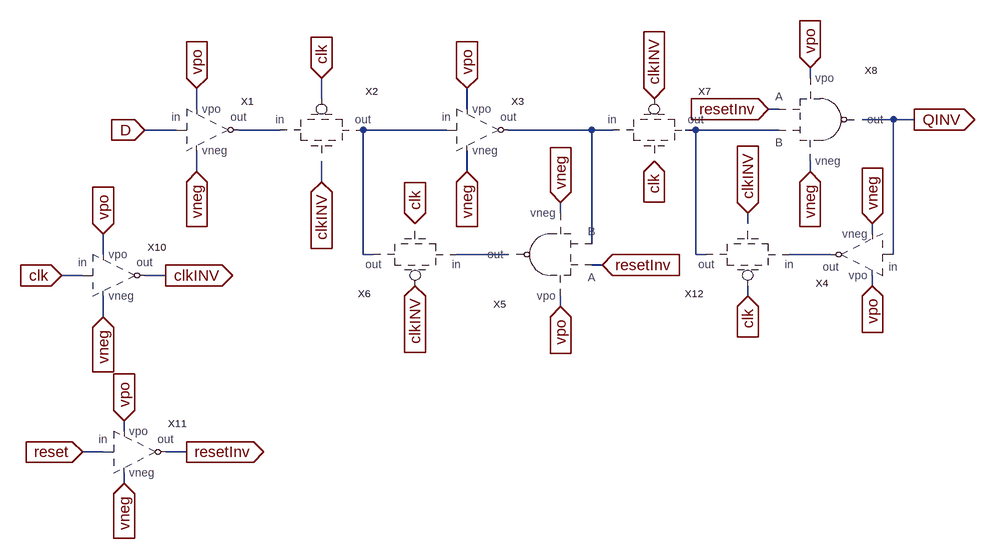
[diagram p0: schematic DFlipFlop.asc]
DFlipFlop.asc, the LTspice schematic file:
Version 4
SHEET 1 1584 1416
WIRE 1168 192 1168 176
WIRE 416 224 416 192
WIRE 224 240 224 208
WIRE 640 240 640 208
WIRE 1120 240 1104 240
WIRE 1296 256 1248 256
WIRE 1328 256 1296 256
WIRE 192 272 144 272
WIRE 352 272 288 272
WIRE 608 272 480 272
WIRE 832 272 704 272
WIRE 864 272 832 272
WIRE 992 272 976 272
WIRE 1120 272 992 272
WIRE 224 336 224 304
WIRE 640 336 640 304
WIRE 1168 336 1168 320
WIRE 416 352 416 320
WIRE 784 400 784 384
WIRE 1072 416 1072 400
WIRE 1264 432 1264 416
WIRE 832 448 832 272
WIRE 80 464 80 432
WIRE 480 464 480 272
WIRE 496 464 480 464
WIRE 704 464 624 464
WIRE 992 464 992 272
WIRE 1008 464 992 464
WIRE 1200 464 1136 464
WIRE 1296 464 1296 256
WIRE 848 480 832 480
WIRE 48 496 16 496
WIRE 176 496 144 496
WIRE 1264 512 1264 496
WIRE 1072 528 1072 512
WIRE 784 544 784 528
WIRE 80 560 80 528
WIRE 112 736 112 720
WIRE 80 768 48 768
WIRE 208 768 176 768
WIRE 112 816 112 800
FLAG 144 272 D
IOPIN 144 272 In
FLAG 16 496 clk
IOPIN 16 496 In
FLAG 176 496 clkINV
IOPIN 176 496 Out
FLAG 416 192 clk
IOPIN 416 192 In
FLAG 416 352 clkINV
IOPIN 416 352 In
FLAG 640 336 vneg
IOPIN 640 336 In
FLAG 640 208 vpo
IOPIN 640 208 In
FLAG 224 208 vpo
IOPIN 224 208 In
FLAG 928 320 clk
IOPIN 928 320 In
FLAG 928 224 clkINV
IOPIN 928 224 In
FLAG 560 512 clkINV
IOPIN 560 512 In
FLAG 560 416 clk
IOPIN 560 416 In
FLAG 224 336 vneg
IOPIN 224 336 In
FLAG 784 384 vneg
IOPIN 784 384 In
FLAG 1168 336 vneg
IOPIN 1168 336 In
FLAG 1264 416 vneg
IOPIN 1264 416 In
FLAG 784 544 vpo
IOPIN 784 544 In
FLAG 1168 176 vpo
IOPIN 1168 176 In
FLAG 1264 512 vpo
IOPIN 1264 512 In
FLAG 848 480 resetInv
IOPIN 848 480 In
FLAG 1104 240 resetInv
IOPIN 1104 240 In
FLAG 48 768 reset
IOPIN 48 768 In
FLAG 208 768 resetInv
IOPIN 208 768 Out
FLAG 80 432 vpo
IOPIN 80 432 In
FLAG 80 560 vneg
IOPIN 80 560 In
FLAG 112 816 vneg
IOPIN 112 816 In
FLAG 112 720 vpo
IOPIN 112 720 In
FLAG 1072 528 clk
IOPIN 1072 528 In
FLAG 1072 400 clkINV
IOPIN 1072 400 In
FLAG 1328 256 QINV
IOPIN 1328 256 Out
SYMBOL Inverter 224 272 R0
SYMATTR InstName X1
SYMBOL Transmissiongate 416 272 R0
SYMATTR InstName X2
SYMBOL Inverter 640 272 R0
SYMATTR InstName X3
SYMBOL Inverter 1264 464 R180
SYMATTR InstName X4
SYMBOL NAND 768 464 R180
SYMATTR InstName X5
SYMBOL Transmissiongate 560 464 R180
SYMATTR InstName X6
SYMBOL Transmissiongate 928 272 R0
SYMATTR InstName X7
SYMBOL NAND 1184 256 R0
SYMATTR InstName X8
SYMBOL Inverter 80 496 R0
SYMATTR InstName X10
SYMBOL Inverter 112 768 R0
SYMATTR InstName X11
SYMBOL Transmissiongate 1072 464 R180
SYMATTR InstName X12

The netlist it stands for:
* DFlipFlop.asc
XX1 D N001 vpo vneg Inverter  ; pins in out vpo vneg
XX2 N001 clk clkINV N002 Transmissiongate  ; pins in SigPmos SigNmos out
XX3 N002 N003 vpo vneg Inverter  ; pins in out vpo vneg
XX4 QINV N006 vpo vneg Inverter  ; pins in out vpo vneg
XX5 vpo vneg N005 resetInv N003 NAND  ; pins vpo vneg out A B
XX6 N005 clkINV clk N002 Transmissiongate  ; pins in SigPmos SigNmos out
XX7 N003 clkINV clk N004 Transmissiongate  ; pins in SigPmos SigNmos out
XX8 vpo vneg QINV resetInv N004 NAND  ; pins vpo vneg out A B
XX10 clk clkINV vpo vneg Inverter  ; pins in out vpo vneg
XX11 reset resetInv vpo vneg Inverter  ; pins in out vpo vneg
XX12 N006 clk clkINV N004 Transmissiongate  ; pins in SigPmos SigNmos out
.backanno
.end